# EAGLE design Moog Light Synth V3 (EAGLE 9.6.2)
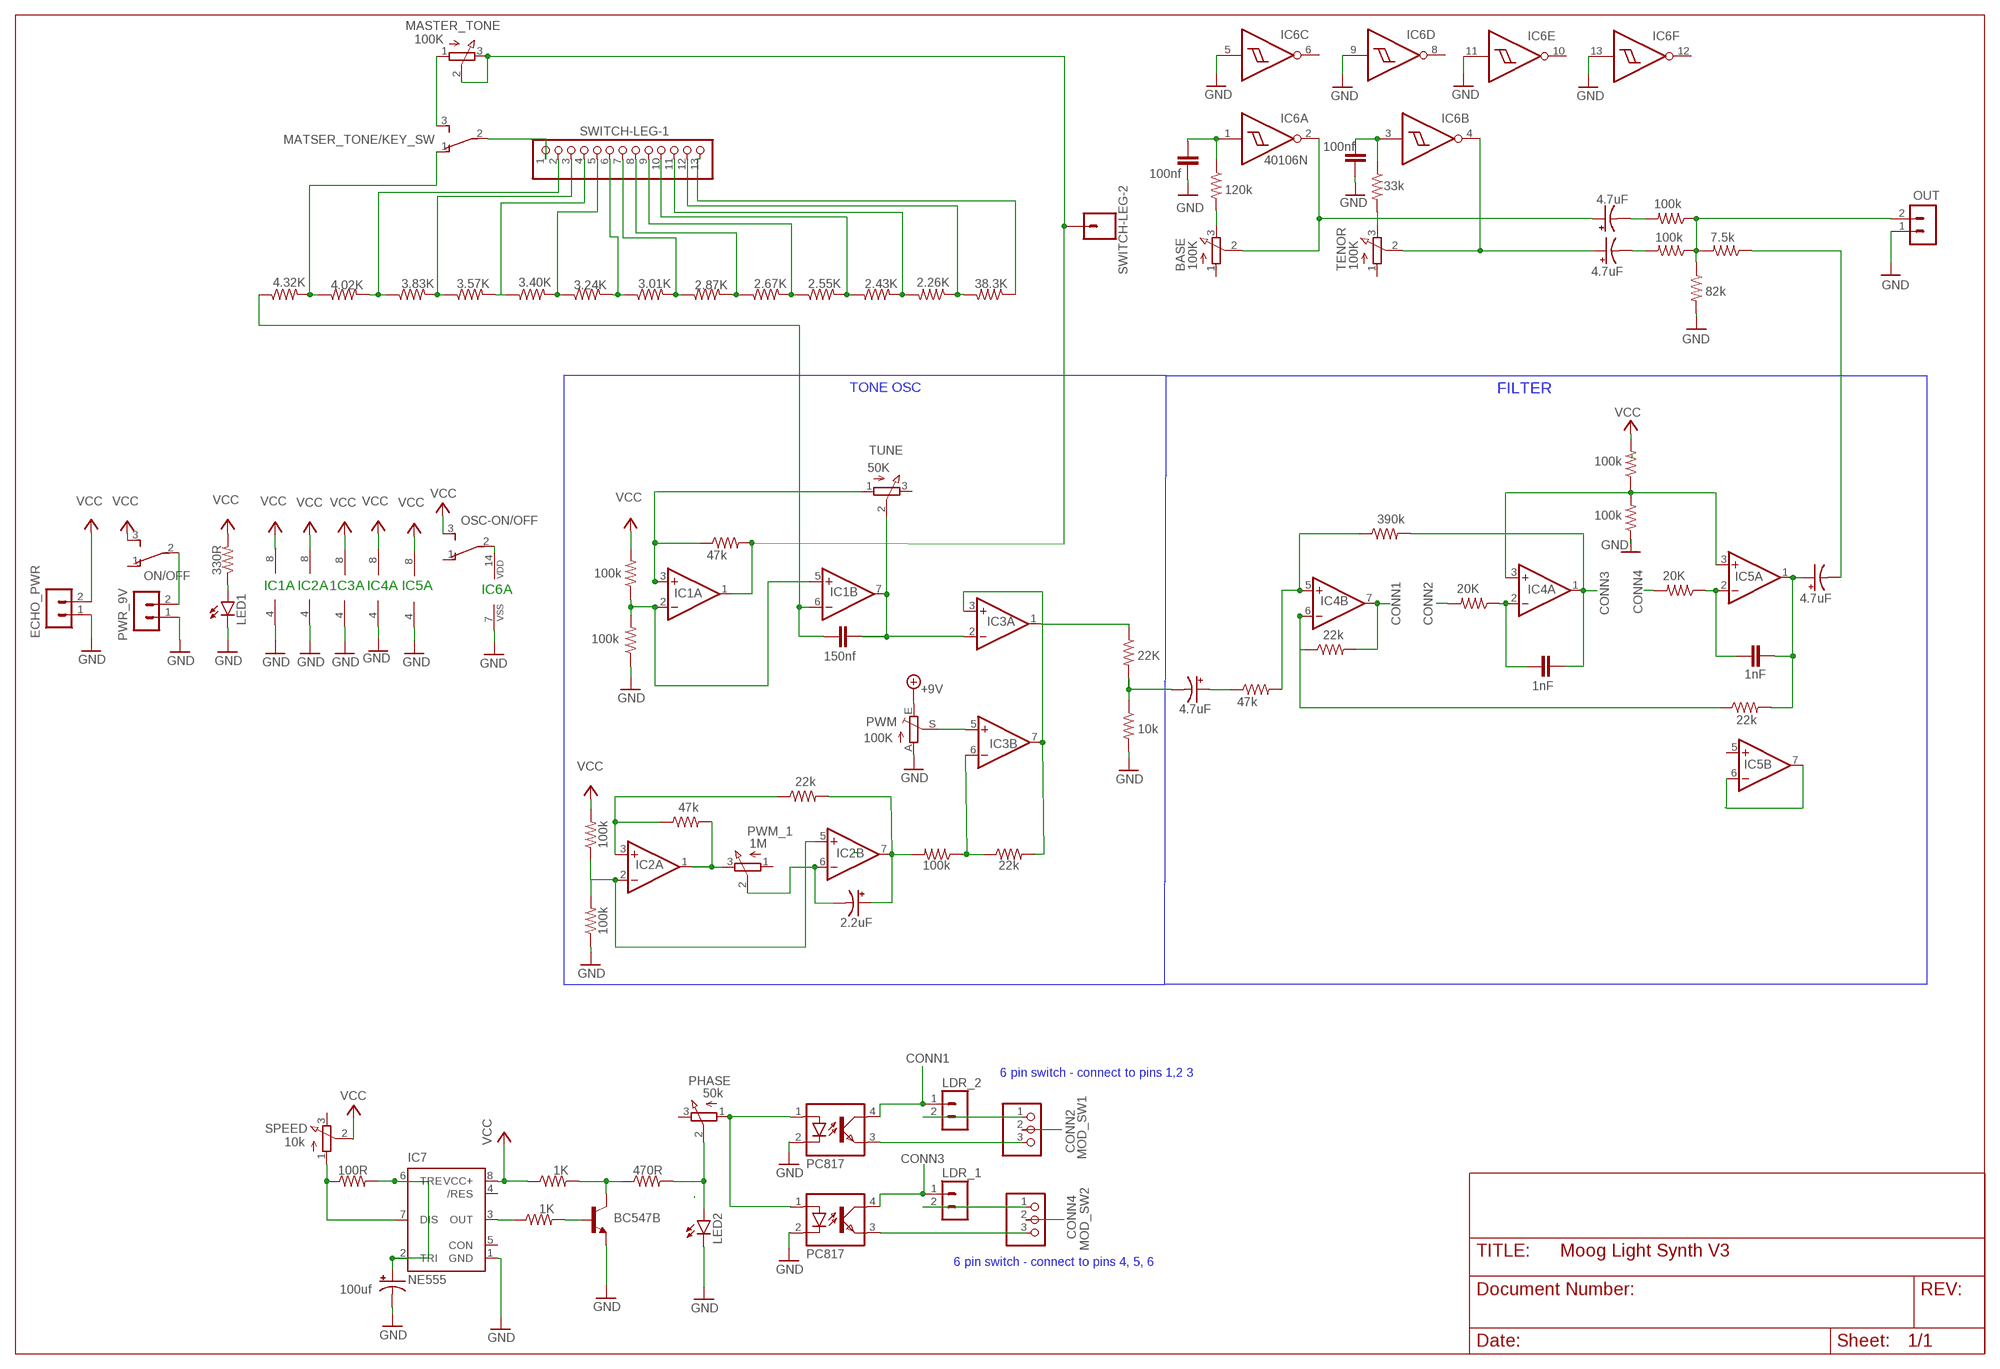
[diagram p0: schematic, sheet 1]

## Parts
BASE  100K  EVUF2A  [EVUF]
C1  150nf  C-EU050-024X044  [C050-024X044]
C2  2.2uF  CPOL-USE2.5-5  [E2,5-5]
C3  4.7uF  CPOL-USE2.5-5  [E2,5-5]
C4  1nF  C-EU050-024X044  [C050-024X044]
C5  1nF  C-EU050-024X044  [C050-024X044]
C6  4.7uF  CPOL-USE2.5-5  [E2,5-5]
C7  100nf  C-EU050-024X044  [C050-024X044]
C8  4.7uF  CPOL-USE2.5-5  [E2,5-5]
C9  4.7uF  CPOL-USE2.5-5  [E2,5-5]
C10  100nf  C-EU050-024X044  [C050-024X044]
C11  100uf  CPOL-USE2.5-5  [E2,5-5]
ECHO_PWR  B2B-PH-K-S  [B2B-PH-K-S]
IC1  LM358N  [DIL08]
IC2  LM358N  [DIL08]
IC3  LM358N  [DIL08]
IC4  LM358N  [DIL08]
IC5  LM358N  [DIL08]
IC6  40106N  [DIL14]
IC7  NE555  [DIL-08]
LDR_1  B2B-PH-K-S  [B2B-PH-K-S]
LDR_2  B2B-PH-K-S  [B2B-PH-K-S]
LED1  LED5MM  [LED5MM]
LED2  LED5MM  [LED5MM]
MASTER_TONE  100K  EVUF2A  [EVUF]
MATSER_TONE/KEY_SW  TL36PO  [TL3XPO]
MOD_SW1  PINHD-1X3  [1X03]
MOD_SW2  PINHD-1X3  [1X03]
OK1  PC817  [DIL04]
OK3  PC817  [DIL04]
ON/OFF  TL36PO  [TL3XPO]
OSC-ON/OFF  TL36PO  [TL3XPO]
OUT  B2B-PH-K-S  [B2B-PH-K-S]
PHASE  50k  EVUF2A  [EVUF]
PWM  100K  TRIM_EU-B25P  [B25P]
PWM_1  1M  EVUF2A  [EVUF]
PWR_9V  B2B-PH-K-S  [B2B-PH-K-S]
Q1  BC547B  [TO92]
R1  100k  R-US_0207/10  [0207/10]
R2  100k  R-US_0207/10  [0207/10]
R3  100k  R-US_0207/10  [0207/10]
R4  100k  R-US_0207/10  [0207/10]
R5  47k  R-US_0207/10  [0207/10]
R6  20K  R-US_0207/10  [0207/10]
R7  100k  R-US_0207/10  [0207/10]
R8  22k  R-US_0207/10  [0207/10]
R9  120k  R-US_0207/10  [0207/10]
R10  10k  R-US_0207/10  [0207/10]
R11  22K  R-US_0207/10  [0207/10]
R12  47k  R-US_0207/10  [0207/10]
R13  22k  R-US_0207/10  [0207/10]
R14  390k  R-US_0207/10  [0207/10]
R15  100k  R-US_0207/10  [0207/10]
R16  47k  R-US_0207/10  [0207/10]
R18  22k  R-US_0207/10  [0207/10]
R19  100k  R-US_0207/10  [0207/10]
R20  20K  R-US_0207/10  [0207/10]
R21  22k  R-US_0207/10  [0207/10]
R22  33k  R-US_0207/10  [0207/10]
R23  100k  R-US_0207/10  [0207/10]
R24  100k  R-US_0207/10  [0207/10]
R25  82k  R-US_0207/10  [0207/10]
R26  7.5k  R-US_0207/10  [0207/10]
R27  4.02K  R-US_0207/10  [0207/10]
R28  3.83K  R-US_0207/10  [0207/10]
R29  3.57K  R-US_0207/10  [0207/10]
R30  3.40K  R-US_0207/10  [0207/10]
R31  3.24K  R-US_0207/10  [0207/10]
R32  3.01K  R-US_0207/10  [0207/10]
R33  2.87K  R-US_0207/10  [0207/10]
R34  4.32K  R-US_0207/10  [0207/10]
R35  2.67K  R-US_0207/10  [0207/10]
R36  2.55K  R-US_0207/10  [0207/10]
R37  330R  R-US_0207/10  [0207/10]
R38  100R  R-US_0207/10  [0207/10]
R39  1K  R-US_0207/10  [0207/10]
R40  470R  R-US_0207/10  [0207/10]
R41  1K  R-US_0207/10  [0207/10]
R42  2.43K  R-US_0207/10  [0207/10]
R43  2.26K  R-US_0207/10  [0207/10]
R44  38.3K  R-US_0207/10  [0207/10]
SPEED  10k  EVUF2A  [EVUF]
SWITCH-LEG-1  PINHD-1X13  [1X13]
SWITCH-LEG-2  CONN_01  [1X01]
TENOR  100K  EVUF2A  [EVUF]
TUNE  50K  EVUF2A  [EVUF]

## Nets
4: LDR_1.2 MOD_SW2.1
CONN1: IC4.7(B:OUT) LDR_2.1 OK1.4(COL) R13.2
CONN2: MOD_SW1.2 R6.2
CONN3: C4.2 IC4.1(A:OUT) LDR_1.1 OK3.4(COL) R14.2
CONN4: MOD_SW2.2 R20.2
GND: C7.1 C10.1 C11.- ECHO_PWR.1 IC1.4(P:V-) IC2.4(P:V-) IC3.4(P:V-) IC4.4(P:V-) IC5.4(P:V-) IC6.5(C:I) IC6.7(P:VSS) IC6.9(D:I) IC6.11(E:I) IC6.13(F:I) IC7.1(GND) LED1.K(C) LED2.K(C) OK1.2(C) OK3.2(C) OUT.1 PWM.A PWR_9V.1 Q1.1(E) R2.1 R3.1 R10.2 R19.1 R25.2
N$1: IC1.3(A:+IN) R5.1 TUNE.1(A)
N$2: C1.1 IC1.6(B:-IN) R34.1
N$3: IC1.2(A:-IN) IC1.5(B:+IN) R1.1 R2.2
N$4: C1.2 IC1.7(B:OUT) IC3.2(A:-IN) TUNE.2(S)
N$5: OK1.1(A) OK3.1(A) PHASE.1(A)
N$6: IC2.2(A:-IN) IC2.5(B:+IN) R3.2 R4.1
N$7: IC2.3(A:+IN) R16.1 R18.1
N$8: IC2.1(A:OUT) PWM_1.3(E) R16.2
N$10: C2.- IC2.6(B:-IN) PWM_1.2(S)
N$11: C2.+ IC2.7(B:OUT) R7.2 R18.2
N$12: IC3.6(B:-IN) R7.1 R8.1
N$13: IC3.3(A:+IN) IC3.7(B:OUT) R8.2
N$14: IC3.5(B:+IN) PWM.S
N$15: IC3.1(A:OUT) R11.1
N$16: C3.- R10.1 R11.2
N$17: C3.+ R12.1
N$18: IC4.5(B:+IN) R12.2 R14.1
N$19: IC4.6(B:-IN) R13.1 R21.1
N$20: R28.2 R29.1 SWITCH-LEG-1.3
N$21: R42.2 R43.2 SWITCH-LEG-1.11
N$22: MATSER_TONE/KEY_SW.1(O) R27.1 R34.2
N$23: C4.1 IC4.2(A:-IN) R6.1
N$24: IC4.3(A:+IN) IC5.3(A:+IN) R15.1 R19.2
N$26: R22.2 TENOR.3(E)
N$27: C5.1 IC5.2(A:-IN) R20.1
N$28: C5.2 C6.+ IC5.1(A:OUT) R21.2
N$29: IC5.6(B:-IN) IC5.7(B:OUT)
N$30: C7.2 IC6.1(A:I) R9.1
N$31: BASE.3(E) R9.2
N$32: BASE.2(S) C8.+ IC6.2(A:O)
N$33: C10.2 IC6.3(B:I) R22.1
N$34: R44.1 SWITCH-LEG-1.13
N$35: C9.+ IC6.4(B:O) TENOR.2(S)
N$36: C8.- R23.2
N$37: C9.- R24.2
N$38: C6.- R26.1
N$39: OUT.2 R23.1 R24.1 R25.1 R26.2
N$40: R30.2 R31.1 SWITCH-LEG-1.5
N$41: R32.2 R33.1 SWITCH-LEG-1.7
N$42: MATSER_TONE/KEY_SW.2(P) SWITCH-LEG-1.1
N$43: MASTER_TONE.1(A) MATSER_TONE/KEY_SW.3(S)
N$44: R36.2 R42.1 SWITCH-LEG-1.10
N$45: R27.2 R28.1 SWITCH-LEG-1.2
N$46: R31.2 R32.1 SWITCH-LEG-1.6
N$47: IC6.14(P:VDD) OSC-ON/OFF.2(P)
N$48: R33.2 R35.1 SWITCH-LEG-1.8
N$49: R35.2 R36.1 SWITCH-LEG-1.9
N$50: IC1.1(A:OUT) MASTER_TONE.2(S) MASTER_TONE.3(E) R5.2 SWITCH-LEG-2.1
N$51: R29.2 R30.1 SWITCH-LEG-1.4
N$52: LED1.A R37.1
N$53: ON/OFF.2(P) PWR_9V.2
N$54: LED2.A PHASE.2(S) R40.2
N$60: C11.+ IC7.2(TRI) IC7.6(TRE) R38.2
N$61: IC7.7(DIS) R38.1 SPEED.1(A)
N$62: Q1.3(C) R40.1 R41.2
N$63: IC7.3(OUT) R39.1
N$64: Q1.2(B) R39.2
N$65: R43.1 R44.2 SWITCH-LEG-1.12
N$71: MOD_SW1.3 OK1.3(EMIT)
N$72: MOD_SW2.3 OK3.3(EMIT)
N$73: LDR_2.2 MOD_SW1.1
VCC: ECHO_PWR.2 IC1.8(P:V+) IC2.8(P:V+) IC3.8(P:V+) IC4.8(P:V+) IC5.8(P:V+) IC7.8(VCC+) ON/OFF.3(S) OSC-ON/OFF.3(S) PWM.E R1.2 R4.2 R15.2 R37.2 R41.1 SPEED.2(S) ; supply symbol labelled +9V
Unconnected: BASE.1(A) IC5.5(B:+IN) IC6.6(C:O) IC6.8(D:O) IC6.10(E:O) IC6.12(F:O) IC7.4(/RES) IC7.5(CON) ON/OFF.1(O) OSC-ON/OFF.1(O) PHASE.3(E) PWM_1.1(A) SPEED.3(E) TENOR.1(A) TUNE.3(E)

## Notes on the sheet
- TONE OSC | FILTER
- IC1A | IC2A | 1C3A | IC4A | IC5A | IC6A
- 6 pin switch - connect to pins 1,2 3
- 6 pin switch - connect to pins 4, 5, 6

## Library data of the parts
BASE MASTER_TONE PHASE PWM_1 SPEED TENOR TUNE = pot:EVU: 9 mm Square Rotary Potentiometers Source: Panasonic
C1 C4 C5 C7 C10 = rcl:C-EU: CAPACITOR, European symbol; SPICEPREFIX: C
C2 C3 C6 C8 C9 C11 = rcl:CPOL-US: POLARIZED CAPACITOR, American symbol; SPICEPREFIX: C
ECHO_PWR LDR_1 LDR_2 OUT PWR_9V = con-JST PH:B2B-PH: JST PH series header 2.00mm pitch disconnectable crimp style connectors, vertical (side entry type), 2 pins
IC1-IC5 = linear:LM358: OP AMP also LM158; LM258; LM2904 Source: http://cache.national.com/ds/LM/LM158.pdf
IC6 = 40xx:40106: Hex SCHMITT TRIGGER
IC7 = st-microelectronics:NE555: General purpose bipolar Timer; MF: Arrow Electronics; MPN: NE555N; OC_FARNELL: 1467742; OC_NEWARK: 89K1486
LED1 LED2 = led:LED: LED OSRAM: - CHIPLED LG R971, LG N971, LY N971, LG Q971, LY Q971, LO R971, LY R971 LH N974, LH R974 LS Q976, LO Q976, LY Q976 LO Q996 - Hyper CHIPLED LW Q18S LB Q993, LB Q99A, LB R99A - SideLED LS A670, LO A670, LY A670, LG A670, LP A670 LB A673, LV A673, LT A673, LW A673 LH A674 LY A675 LS A676, LA A676, LO A676, LY A676, LW A676 LS A679, LY A679, LG A679 - Hyper Micro SIDELED® LS Y876, LA Y876, LO Y876, LY Y876 LT Y87S - SmartLED LW L88C, LW L88S LB L89C, LB L89S, LG L890 LS L89K, LO L89K, LY L89K LS L896, LA L896, LO L896, LY L896 - TOPLED LS T670, LO T670, LY T670, LG T670, LP T670 LSG T670, LSP T670, LSY T670, LOP T670, LYG T670 LG T671, LOG T671, LSG T671 LB T673, LV T673, LT T673, LW T673 LH T674 LS T676, LA T676, LO T676, LY T676, LB T676, LH T676, LSB T676, LW T676 LB T67C, LV T67C, LT T67C, LS T67K, LO T67K, LY T67K, LW E67C LS E67B, LA E67B, LO E67B, LY E67B, LB E67C, LV E67C, LT E67C LW T67C LS T679, LY T679, LG T679 LS T770, LO T770, LY T770, LG T770, LP T770 LB T773, LV T773, LT T773, LW T773 LH T774 LS E675, LA E675, LY E675, LS T675 LS T776, LA T776, LO T776, LY T776, LB T776 LHGB T686 LT T68C, LB T68C - Hyper Mini TOPLED® LB M676 - Mini TOPLED Santana® LG M470 LS M47K, LO M47K, LY M47K Source: http://www.osram.convergy.de LUXEON: - LUMILED® LXK2-PW12-R00, LXK2-PW12-S00, LXK2-PW14-U00, LXK2-PW14-V00 LXK2-PM12-R00, LXK2-PM12-S00, LXK2-PM14-U00 LXK2-PE12-Q00, LXK2-PE12-R00, LXK2-PE12-S00, LXK2-PE14-T00, LXK2-PE14-U00 LXK2-PB12-K00, LXK2-PB12-L00, LXK2-PB12-M00, LXK2-PB14-N00, LXK2-PB14-P00, LXK2-PB14-Q00 LXK2-PR12-L00, LXK2-PR12-M00, LXK2-PR14-Q00, LXK2-PR14-R00 LXK2-PD12-Q00, LXK2-PD12-R00, LXK2-PD12-S00 LXK2-PH12-R00, LXK2-PH12-S00 LXK2-PL12-P00, LXK2-PL12-Q00, LXK2-PL12-R00 Source: www.luxeon.com KINGBRIGHT: KA-3528ASYC Source: www.kingbright.com
MATSER_TONE/KEY_SW ON/OFF OSC-ON/OFF = switch:TL36PO: TINY SWITCH ON - ON Source: http://www2.produktinfo.conrad.com/datenblaetter/700000-724999/705152-da-01-de-Subminiaturschalter_TL_36YO.pdf
MOD_SW1 MOD_SW2 = pinhead:PINHD-1X3: PIN HEADER
OK1 OK3 = optocoupler:PC817: SHARP OPTO COUPLER; MPN: PC817X4J000F; OC_FARNELL: 9707727; OC_NEWARK: 97K7059
PWM = pot:TRIM_EU-: POTENTIOMETER
Q1 = transistor-npn:BC547*: NPN Transistor
R1-R16 R18-R44 = rcl:R-US_: RESISTOR, American symbol; SPICEPREFIX: R
SWITCH-LEG-1 = pinhead:PINHD-1X13: PIN HEADER
SWITCH-LEG-2 = SparkFun-Connectors:CONN_01: Single connection point. Often used as Generic Header-pin footprint for 0.1 inch spaced/style header connections On any of the 0.1 inch spaced packages, you can populate with these: Break Away Headers - Straight <https://www.sparkfun.com/products/116> (PRT-00116) Break Away Male Headers - Right Angle <https://www.sparkfun.com/products/553> (PRT-00553) Female Headers <https://www.sparkfun.com/products/115> (PRT-00115) Break Away Headers - Machine Pin <https://www.sparkfun.com/products/117> (PRT-00117) Break Away Female Headers - Swiss Machine Pin <https://www.sparkfun.com/products/743> (PRT-00743) This device is also useful as a general connection point to wire up your design to another part of your project. Our various solder wires solder well into these plated through hole pads. Hook-Up Wire - Assortment (Stranded, 22 AWG) <https://www.sparkfun.com/products/11375> (PRT-11375) Hook-Up Wire - Assortment (Solid Core, 22 AWG) <https://www.sparkfun.com/products/11367> (PRT-11367) View the entire wire category on our website here <https://www.sparkfun.com/categories/141> Special notes: SMTSO-256-ET is a "flush mount" nut for a 4-40 screw. We mostly use this on specialty testbeds; it is a nice way to connect hardware to your PCB at an adjustable hieght. Also note, the SNAP packages are for using a snappable style connector. We sell a baggie of snaps and they are also used on two LilyPad designs: Snap Assortment - 30 pack (male and female) <https://www.sparkfun.com/products/11347> (DEV-11347) LilyPad Arduino SimpleSnap <https://www.sparkfun.com/products/10941> (DEV-10941) LilyPad SimpleSnap Protoboard <https://www.sparkfun.com/products/10940> (DEV-10940)

## Board
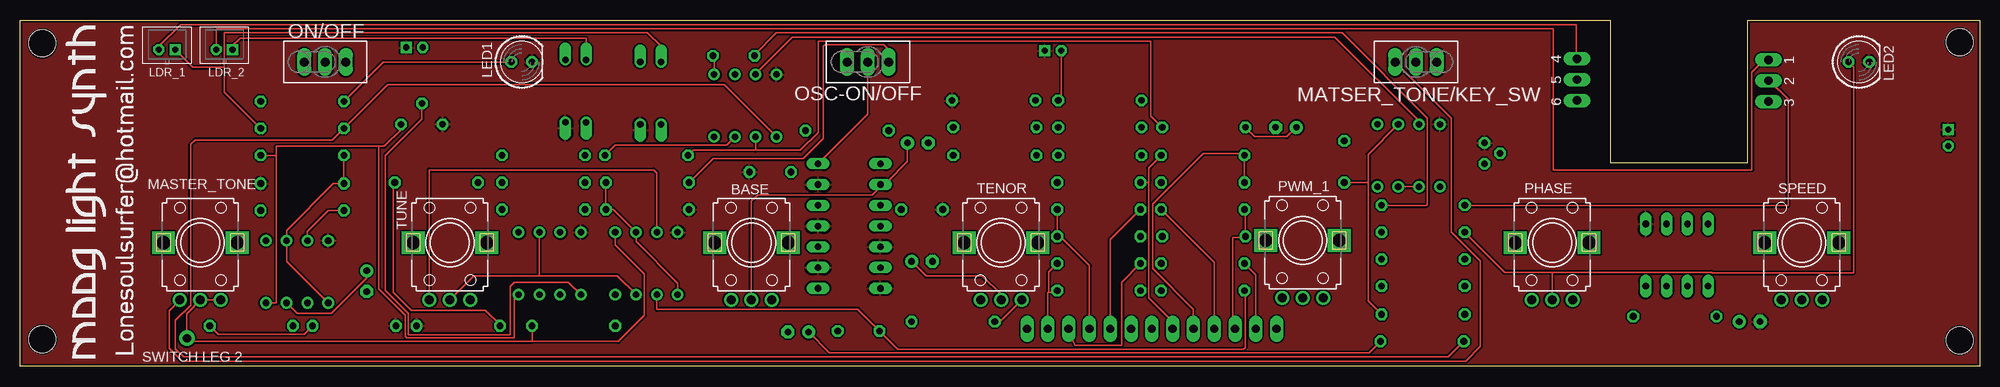
[diagram p1: board, top side]
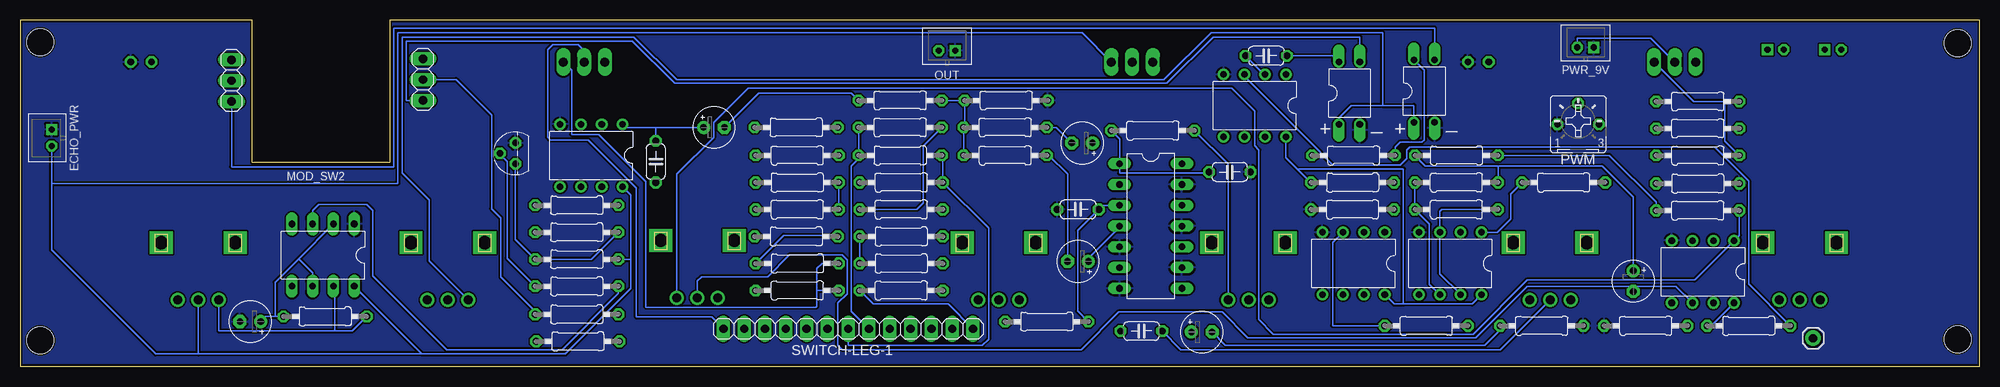
[diagram p2: board, bottom side, seen from below]

Size 239.27 x 42.29 mm. Coordinates in mm from the lower left corner, seen from the top.
Outline: 0,42.29 194.18,42.29 194.18,24.89 210.95,24.89 210.95,42.29 239.27,42.29 239.27,0 0,0 0,42.29
Copper layers (1*16): Top 0.035mm / dielectric 1.5mm / Bottom 0.035mm
Design rules "SparkFun": minimum track width 8mil, minimum drill 20mil, track to track 8mil, track to pad 8mil, pad to pad 8mil, via to via 8mil, smd to smd 8mil, copper to edge 8mil, drill to drill 8mil, minimum pad ring 12mil, minimum via ring 10mil, stop-mask expansion 4mil, vias tented up to drill 20mil, thermal gap 10mil
Holes 3.3 mm at 2.67,39.5 2.67,3.3 236.85,39.62 236.85,3.17

### Footprints (pad centres in the part's own frame; a part is rotated, then mirrored left to right if it is on the bottom)
EVUF = drill 1.1 pad 1.676: 1 -2.5,-7; 2 0,-7; 3 2.5,-7 | drill 1.6 pad 2.8 square: M1 4.5,0; M2 -4.5,0
C050-024X044 = drill 0.813 octagon: 1 -2.54,0; 2 2.54,0
E2,5-5 = drill 0.813 pad 1.6: + -1.27,0 | drill 0.813 pad 1.6 octagon: - 1.27,0
B2B-PH-K-S = drill 0.75 pad 1.3 square: 1 1,0 | drill 0.75 pad 1.3 octagon: 2 -1,0
DIL08 = drill 0.813 pad 1.27: 1 -3.81,-3.81; 2 -1.27,-3.81; 3 1.27,-3.81; 4 3.81,-3.81; 5 3.81,3.81; 6 1.27,3.81; 7 -1.27,3.81; 8 -3.81,3.81
DIL14 = drill 0.813 long: 1 -7.62,-3.81; 2 -5.08,-3.81; 3 -2.54,-3.81; 4 0,-3.81; 5 2.54,-3.81; 6 5.08,-3.81; 7 7.62,-3.81; 8 7.62,3.81; 9 5.08,3.81; 10 2.54,3.81; 11 0,3.81; 12 -2.54,3.81; 13 -5.08,3.81; 14 -7.62,3.81
DIL-08 = drill 0.813 long: 1 -3.81,-3.81; 2 -1.27,-3.81; 3 1.27,-3.81; 4 3.81,-3.81; 5 3.81,3.81; 6 1.27,3.81; 7 -1.27,3.81; 8 -3.81,3.81
LED5MM = drill 0.813 octagon: A -1.27,0; K 1.27,0
TL3XPO = drill 1.1 pad 1.422 long: 1 -2.54,0; 2 0,0; 3 2.54,0
1X03 = drill 1.016 long: 1 -2.54,0; 2 0,0; 3 2.54,0
DIL04 = drill 0.813 offset: 1 -1.27,-3.81; 2 1.27,-3.81; 3 1.27,3.81; 4 -1.27,3.81
B25P = drill 0.813 octagon: A -2.54,0; E 2.54,0; S 0,2.54
TO92 = drill 0.813 octagon: 1 1.27,0; 2 0,1.905; 3 -1.27,0
0207/10 = drill 0.813 octagon: 1 -5.08,0; 2 5.08,0
1X13 = drill 1.016 long: 1 -15.24,0; 2 -12.7,0; 3 -10.16,0; 4 -7.62,0; 5 -5.08,0; 6 -2.54,0; 7 0,0; 8 2.54,0; 9 5.08,0; 10 7.62,0; 11 10.16,0; 12 12.7,0; 13 15.24,0
1X01 = drill 1.016 pad 1.88: 1 0,0

### Placement (x,y rotation side)
BASE  89.28,15.11 0 top
C1  102.36,4.32 0 bottom
C2  42.29,10.41 270 bottom
C3  95,4.19 0 bottom
C4  87.12,37.97 0 bottom
C5  161.67,25.02 90 bottom
C6  154.56,29.21 0 bottom
C7  91.57,23.75 180 bottom
C8  109.6,27.3 180 bottom
C9  110.11,12.83 180 bottom
C10  110.11,19.18 0 bottom
C11  211.2,5.46 180 bottom
ECHO_PWR  235.46,27.94 90 bottom
IC1  76.45,12.57 180 bottom
IC2  33.78,11.56 180 bottom
IC3  64.64,12.57 180 bottom
IC4  88.52,31.88 180 bottom
IC5  169.54,25.78 180 bottom
IC6  101.22,17.14 270 bottom
IC7  202.31,13.59 180 bottom
LDR_1  17.91,38.73 0 top
LDR_2  24.89,38.73 0 top
LED1  61.21,37.21 0 top
LED2  224.54,37.21 0 top
MASTER_TONE  21.97,15.11 0 top
MATSER_TONE/KEY_SW  170.43,37.21 180 top
MOD_SW1  213.49,34.92 270 bottom
MOD_SW2  190.12,35.05 270 bottom
OK1  67.82,33.66 0 bottom
OK3  76.96,33.4 0 bottom
ON/OFF  37.21,37.21 0 top
OSC-ON/OFF  103.5,37.21 0 top
OUT  126.11,38.61 0 bottom
PHASE  187.07,15.11 0 top
PWM  49.02,29.59 0 bottom
PWM_1  156.59,15.37 0 top
PWR_9V  48.13,38.99 0 bottom
Q1  178.82,26.04 90 bottom
R1  76.58,22.48 180 bottom
R2  76.58,19.18 0 bottom
R3  34.42,22.35 180 bottom
R4  34.42,25.78 0 bottom
R5  67.56,4.95 0 bottom
R6  171.32,19.68 180 bottom
R7  63.88,22.48 0 bottom
R8  63.88,19.18 0 bottom
R9  100.97,28.83 0 bottom
R10  53.47,4.95 0 bottom
R11  50.8,22.48 0 bottom
R12  171.2,3.05 180 bottom
R13  76.45,25.78 0 bottom
R14  34.42,29.08 0 bottom
R15  28.19,4.95 180 bottom
R16  34.42,19.05 0 bottom
R18  63.88,25.78 180 bottom
R19  40.77,4.95 0 bottom
R20  171.32,6.35 180 bottom
R21  144.53,29.21 180 bottom
R22  113.92,5.46 180 bottom
R23  119,29.21 0 bottom
R24  119,25.78 0 bottom
R25  118.87,32.51 0 bottom
R26  131.83,32.51 0 bottom
R27  144.4,12.57 180 bottom
R28  144.53,15.88 180 bottom
R29  144.4,19.18 0 bottom
R30  144.4,22.48 180 bottom
R31  144.4,25.78 0 bottom
R32  131.7,22.48 0 bottom
R33  131.83,25.78 180 bottom
R34  144.4,9.27 0 bottom
R35  131.83,29.21 0 bottom
R36  131.7,19.18 0 bottom
R37  34.42,32.38 0 bottom
R38  202.06,6.1 180 bottom
R39  171.32,9.78 180 bottom
R40  171.32,16.38 180 bottom
R41  171.32,13.08 180 bottom
R42  131.7,15.88 180 bottom
R43  131.7,12.57 180 bottom
R44  131.7,9.27 0 bottom
SPEED  217.55,15.11 0 top
SWITCH-LEG-1  138.18,4.57 0 bottom
SWITCH-LEG-2  20.32,3.43 0 bottom
TENOR  119.76,15.11 0 top
TUNE  52.45,15.11 0 top

### Tracks (layer width: path | path; a pad name or v marks a point on that pad's centre or on a via)
4
  Top 0.203: MOD_SW2.1 189.99,37.72 189.99,41.78 19.56,41.78 16.91,39.13 LDR_1.2
CONN1
  Top 0.203: OK1.4 69.09,40.11 26.82,40.11 25.89,39.18 LDR_2.1 | R13.2 72.64,27.05 86.23,27.05 IC4.7
  Bottom 0.203: OK1.4 67.82,36.19 67.82,27.69 68.1,27.41 70.76,27.41 71.37,26.8 R13.2
CONN2
  Top 0.203: R6.2 215.9,19.68 215.9,32.64 213.61,34.92 MOD_SW1.2
CONN3
  Top 0.203: IC4.1 84.71,37.85 C4.2 | OK3.4 78.23,39.12 76.58,40.77 24.89,40.77 24.89,36.58 | R14.2 24.89,33.53 24.89,36.58 | LDR_1.1 21.07,36.58 24.89,36.58
  Bottom 0.203: OK3.4 78.99,37.97 C4.2
CONN4
  Bottom 0.203: R20.2 176.4,6.73 180.6,10.92 180.6,18.12 181.74,19.26 181.74,30.73 186.05,35.05 MOD_SW2.2
GND
  pour Top: 0,42.29 194.18,42.29 194.18,24.89 210.95,24.89 210.95,42.29 239.27,42.29 239.27,0 0,0
  pour Bottom: 0,42.29 194.18,42.29 194.18,24.89 210.95,24.89 210.95,42.29 239.27,42.29 239.27,0 0,0
N$1
  Top 0.203: TUNE.1 49.91,8.15 49.91,24 77.34,24 77.72,23.62 IC1.3
  Bottom 0.203: IC1.3 78.99,15.11 78.99,4.95 R5.1
N$2
  Top 0.203: IC1.6 77.72,6.95 102.27,6.95 C1.1 107.16,2.06 149.35,2.06 149.58,2.29 149.58,9.17 R34.1
N$3
  Top 0.203: IC1.5 80.26,10.16 75.18,15.24 IC1.2 72.39,19.18 R2.2 R1.1
N$4
  Top 0.203: TUNE.2 55.39,11.05 63.37,11.05 | 63.37,11.05 IC3.2 | IC1.7 72.9,11.05 63.37,11.05
  Bottom 0.203: TUNE.2 58.53,2.03 97.54,2.03 C1.2
N$5
  Bottom 0.203: 72.9,31.88 69.09,31.88 OK1.1 | 72.9,31.88 76.71,31.88 78.23,30.35 OK3.1 | 72.9,31.88 72.9,40.82 93.85,40.82 99.62,35.05 159.13,35.05 164.34,40.26 192.63,40.26 192.63,23.62 189.36,20.34 189.36,12.9 PHASE.1
N$6
  Top 0.203: R4.1 R3.2 38.23,22.35 32.51,16.64 IC2.2 32.51,12.83 IC2.5
N$7
  Top 0.203: IC2.3 35.05,16.51 37.59,19.05 R16.1
  Bottom 0.203: R16.1 39.5,20.07 45.21,25.78 R18.1
N$8
  Bottom 0.203: R16.2 29.34,16 IC2.1 34.8,10.54 55.24,10.54 61.85,3.94 86.23,3.94 88.01,5.71 88.01,26.46 88.52,26.96 88.52,31.2 91.35,34.04 150.37,34.04 154.6,29.81 154.6,27.99 159.09,23.5 PWM_1.3
N$10
  Bottom 0.203: 42.29,9.78 37.08,9.78 IC2.6 | 42.29,9.78 55.24,9.78 61.52,3.5 89.38,3.5 92.51,6.63 105.13,6.63 109.73,2.03 138.88,2.03 139.42,2.57 139.42,7.73 138.3,8.85 138.3,12.99 138.9,13.59 145.35,13.59 148.02,10.92 156.08,10.92 156.59,10.41 PWM_1.2 | C2.- 42.29,9.78
N$11
  Top 0.203: IC2.7 33.78,6.48 37.97,6.48 42.29,10.79 C2.+
  Bottom 0.203: R7.2 58.8,24.51 | 58.8,24.51 46.1,24.51 42.29,20.7 C2.+ | 58.8,24.51 67.69,24.51 R18.2
N$12
  Bottom 0.203: IC3.6 67.18,10.03 67.18,17.4 R8.1 R7.1
N$13
  Bottom 0.203: IC3.7 65.91,11.3 IC3.3 65.91,18.92 65.66,19.18 R8.2
N$14
  Top 0.203: PWM.S 49.02,30.23 44.58,25.78 44.58,9.27 47.37,6.48 47.37,3.86 59.82,3.86 59.82,9.78 60.32,10.29 66.93,10.29 IC3.5
N$15
  Bottom 0.203: R11.1 57.28,21.08 57.28,18.02 58.91,16.38 IC3.1
N$16
  Top 0.203: R11.2 45.64,22.48 45.55,22.39 45.55,9.05 47.75,6.86 56.8,6.86 58.55,5.11 R10.1
  Bottom 0.203: C3.- 92.1,2.56 60.45,2.56 58.55,4.47 R10.1
N$17
  Top 0.203: C3.+ 98.81,1.65 164.72,1.65 R12.1
N$18
  Top 0.203: R12.2 174.37,1.14 19.94,1.14 18.92,2.16 18.92,5.59 20.81,7.48 20.81,27.16 21.34,27.69 38.1,27.69 R14.1 44.83,34.42 85.98,34.42 IC4.5
N$19
  Top 0.203: R21.1 138.05,30.61 138.05,39.75 97.41,39.75 97.41,28.57 95.25,26.42 89.79,26.42 | R13.1 82.17,26.42 89.79,26.42 | IC4.6 89.79,26.42
N$20
  Top 0.203: SWITCH-LEG-1.3 148.06,4.84 148.06,15.75 149.61,15.75 R28.2 149.61,19.05 R29.1
N$21
  Top 0.203: SWITCH-LEG-1.11 128.78,2.54 134.49,2.54 134.49,10.29 R43.2
  Bottom 0.203: R42.2 R43.2
N$22
  Bottom 0.203: R27.1 141.35,12.57 141.99,11.94 141.99,9.27 | 141.99,9.27 141.99,7.33 142.11,7.21 162.89,7.21 162.89,22.62 168.62,28.35 171.96,28.35 171.96,36.19 MATSER_TONE/KEY_SW.1 | 141.99,9.27 R34.2
N$23
  Top 0.203: C4.1 89.66,38.1 92.33,40.77 161.42,40.77 171.83,30.35 171.83,19.81 171.7,19.68 R6.1
  Bottom 0.203: IC4.2 87.38,35.69 C4.1
N$24
  Top 0.203: IC4.3 89.79,35.81 94.23,40.26 160.53,40.26 170.81,29.97 IC5.3 | R19.2 34.67,3.94 24.13,3.94 R15.1
  Bottom 0.203: IC4.3 89.79,35.47 80.52,26.2 80.52,26.16 78.99,24.64 70.74,24.64 69.98,25.4 69.98,26.42 69.6,26.8 32.34,26.8 28.21,22.66 28.21,10.05 R15.1
N$26
  Top 0.203: TENOR.3 119.61,5.46 R22.2
N$27
  Top 0.203: IC5.2 164.59,25.91 164.59,22.48 | R20.1 164.59,8 164.59,22.48 | C5.1 164.59,22.48
N$28
  Top 0.203: R21.2 150.75,28.07 154.69,28.07 C6.+
  Bottom 0.203: IC5.1 165.35,29.21 161.67,29.21 | 161.67,29.21 C6.+ | C5.2 161.67,29.21
N$29
  Top 0.203: IC5.7 IC5.6
N$30
  Bottom 0.203: R9.1 105.03,27.81 IC6.1 105.03,23.62 94.23,23.62 C7.2
N$31
  Bottom 0.203: R9.2 91.78,24.73 BASE.3
N$32
  Top 0.203: BASE.2 89.28,20.19 90.04,20.96 104.01,20.96 105.03,21.97 IC6.2 105.28,22.48 105.79,22.48 108.33,25.02 C8.+
N$33
  Bottom 0.203: IC6.3 107.06,19.68 C10.2 110.15,16.6 110.15,6.77 R22.1
N$34
  Bottom 0.203: SWITCH-LEG-1.13 125.98,7.62 135.13,7.62 R44.1
N$35
  Top 0.203: C9.+ 110.62,11.05 117.47,11.05 119.76,8.76 TENOR.2
  Bottom 0.203: C9.+ 108.84,13.21 105.03,17.02 IC6.4
N$36
  Bottom 0.203: C8.- 112.78,29.21 R23.2
N$37
  Bottom 0.203: C9.- 111.38,23.5 113.66,25.78 R24.2
N$38
  Bottom 0.203: C6.- 149.1,33.4 137.79,33.4 R26.1
N$39
  Top 0.203: OUT.2 127.11,32.88 R26.2
  Bottom 0.203: R24.1 R23.1 123.95,29.34 R25.1 R26.2
N$40
  Top 0.203: SWITCH-LEG-1.5 143.26,6.98 138.3,11.94 138.3,19.85 144.49,26.04 149.22,26.04 R31.1 R30.2
N$41
  Bottom 0.203: R33.1 126.62,25.65 R32.2 121.03,16.89 121.03,3.3 121.79,2.54 138.18,2.54 SWITCH-LEG-1.7
N$42
  Bottom 0.203: SWITCH-LEG-1.1 154.86,6.02 164.06,6.02 164.06,21.82 169.93,27.69 174.54,27.69 174.88,28.03 174.88,38.71 174.24,39.34 171.17,39.34 170.43,38.61 MATSER_TONE/KEY_SW.2
N$43
  Top 0.203: MATSER_TONE/KEY_SW.3 174.75,30.35 174.75,16.42 178.31,12.87 178.31,2.41 176.53,0.63 19.74,0.63 18.16,2.22 18.16,6.8 MASTER_TONE.1
N$44
  Top 0.203: R42.1 126.62,16.26 | 126.62,16.26 R36.2 | 126.62,16.26 130.56,12.32 SWITCH-LEG-1.10
N$45
  Top 0.203: R27.2 150.88,11.18 SWITCH-LEG-1.2
  Bottom 0.203: R27.2 146.05,16 139.57,16 R28.1
N$46
  Top 0.203: SWITCH-LEG-1.6 140.72,5.46 137.79,8.38 137.79,22.48 | R32.1 137.79,22.48 | R31.2 137.79,24.26 137.79,22.48
N$47
  Top 0.203: IC6.14 103.5,30.86 OSC-ON/OFF.2
N$48
  Bottom 0.203: R35.1 R33.2 136.91,25.4 137.79,24.51 137.79,6.73 SWITCH-LEG-1.8
N$49
  Top 0.203: R36.1 133.1,15.49 SWITCH-LEG-1.9
  Bottom 0.203: R35.2 129.03,26.92 129.03,19.94 129.79,19.18 R36.1
N$50
  Top 0.203: 62.48,3.05 20.32,3.05 SWITCH-LEG-2.1 20.32,6.41 21.22,7.31 21.22,7.36 MASTER_TONE.2 MASTER_TONE.3 | 62.48,3.05 R5.2 | 62.48,3.05 73.03,3.05 76.2,6.22 76.2,11.3 72.64,14.86 IC1.1
N$51
  Top 0.203: SWITCH-LEG-1.4 145.8,12.7 R29.2
  Bottom 0.203: R30.1 R29.2
N$52
  Top 0.203: R37.1 44.32,37.21 LED1.A
N$53
  Bottom 0.203: ON/OFF.2 40.13,40.13 49.15,40.13 49.15,39 PWR_9V.2
N$54
  Top 0.203: R40.2 181.29,11.49 187.01,11.49 187.07,11.43 | 187.07,11.43 187.07,11.51 206.54,11.51 206.62,11.43 223.9,11.43 223.9,36.58 LED2.A | PHASE.2 187.07,11.43
N$60
  Bottom 0.203: C11.+ 209.3,6.1 208.15,6.1 | 208.15,6.1 R38.2 | IC7.2 205.3,13.14 | 205.3,13.14 208.15,10.29 208.15,6.1 | IC7.6 203.58,11.43 205.3,13.14
N$61
  Bottom 0.203: SPEED.1 215.05,4.32 200.91,4.32 | IC7.7 200.91,9.65 200.91,4.32 | R38.1 198.75,4.32 200.91,4.32
N$62
  Bottom 0.203: Q1.3 178.82,15.49 R41.2 169.54,13.08 R40.1
N$63
  Bottom 0.203: R39.1 166.24,8.89 173.1,2.03 187.2,2.03 196.22,11.05 196.22,19.05 196.98,19.81 202.82,19.81 203.58,19.05 IC7.3
N$64
  Bottom 0.203: Q1.2 180.72,25.91 179.83,25.02 179.83,13.21 R39.2
N$65
  Top 0.203: SWITCH-LEG-1.12 125.48,9.02 125.6,9.02 | 125.6,9.02 125.6,11.56 R43.1 | R44.2 126.37,9.02 125.6,9.02
N$71
  Bottom 0.203: OK1.3 66.55,41.35 193.67,41.35 193.67,24.38 213.49,24.38 MOD_SW1.3
N$72
  Bottom 0.203: MOD_SW2.3 192.15,32.51 192.15,39.75 164.53,39.75 159.39,34.61 99.25,34.61 93.6,40.26 75.69,40.26 OK3.3
N$73
  Top 0.203: MOD_SW1.1 212.98,37.46 211.45,35.94 211.45,24 187.2,24 187.2,41.27 24,41.27 23.89,41.16 LDR_2.2
VCC
  Top 0.203: 31.24,25.78 31.24,26.92 43.78,26.92 | 31.24,25.78 31.24,7.75 IC2.8 | IC3.8 60.32,8.25 60.32,3.45 47.2,3.45 46.97,3.69 46.97,6.25 43.78,9.44 43.78,26.92 | R1.2 84.58,25.4 95.59,25.4 98.04,27.85 98.04,39.12 98.27,39.34 105.41,39.34 106.04,38.71 OSC-ON/OFF.3 | 31.24,25.78 R4.2 | PWM.E 46.48,28.96 44.45,26.92 43.78,26.92
  Bottom 0.203: R15.2 32.77,4.95 IC2.8 | IC4.8 84.71,25.53 83.31,24.13 | 83.31,24.13 R1.2 | IC3.8 61.98,7.62 70.36,7.62 | IC1.8 71.5,7.62 70.36,7.62 | 83.31,24.13 70.36,24.13 70.36,7.62 | IC5.8 164.72,20.96 164.72,13.08 | 164.72,13.08 164.72,9.53 172.72,1.52 190.25,1.52 | IC7.8 190.25,1.52 | 190.25,1.52 217.55,1.52 | 217.55,1.52 SPEED.2 | 217.55,1.52 222.76,1.52 235.46,14.22 235.46,22.35 | 235.46,22.35 193.17,22.35 193.17,40.77 109.6,40.77 OSC-ON/OFF.3 | R41.1 164.72,13.08 | R4.2 31.11,27.56 31.11,32.38 R37.2 34.92,32.38 ON/OFF.3 | 235.46,22.35 ECHO_PWR.2

### Text on the board
tPlace: 4 | 1 | 5 | 2 | 6 | 3 | SWITCH LEG 2
bPlace: _ | _ | + | +